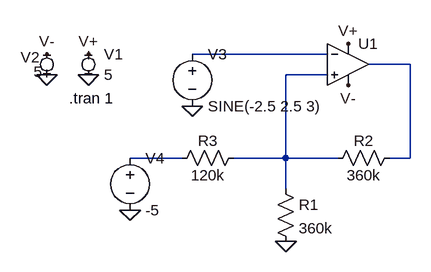
[diagram p0: schematic Zcourbe.asc]
Zcourbe.asc, the LTspice schematic file:
Version 4
SHEET 1 880 680
WIRE 176 112 -32 112
WIRE 304 128 240 128
WIRE 176 144 112 144
WIRE -48 272 -128 272
WIRE 112 272 112 144
WIRE 112 272 32 272
WIRE 192 272 112 272
WIRE 304 272 304 128
WIRE 304 272 272 272
WIRE 112 320 112 272
FLAG -192 112 V+
FLAG 208 96 V+
FLAG -192 144 0
FLAG -256 112 V-
FLAG -256 144 0
FLAG -32 192 0
FLAG 112 400 0
FLAG -128 352 0
FLAG 208 160 V-
SYMBOL MiniSyms4\\voltage- -192 128 R0
WINDOW 123 0 0 Left 2
WINDOW 39 0 0 Left 2
SYMATTR InstName V1
SYMATTR Value 5
SYMBOL MiniSyms4\\voltage- -256 128 R180
WINDOW 0 11 11 Left 2
WINDOW 3 7 -11 Left 2
WINDOW 123 0 0 Left 2
WINDOW 39 0 0 Left 2
SYMATTR InstName V2
SYMATTR Value 5
SYMBOL voltage -32 96 R0
WINDOW 123 0 0 Left 2
WINDOW 39 0 0 Left 2
SYMATTR InstName V3
SYMATTR Value SINE(-2.5 2.5 3)
SYMBOL res 96 304 R0
SYMATTR InstName R1
SYMATTR Value 360k
SYMBOL res 288 256 R90
WINDOW 0 5 56 VBottom 2
WINDOW 3 27 56 VTop 2
SYMATTR InstName R2
SYMATTR Value 360k
SYMBOL res 48 256 R90
WINDOW 0 5 56 VBottom 2
WINDOW 3 27 56 VTop 2
SYMATTR InstName R3
SYMATTR Value 120k
SYMBOL voltage -128 256 R0
WINDOW 123 0 0 Left 2
WINDOW 39 0 0 Left 2
SYMATTR InstName V4
SYMATTR Value -5
SYMBOL Opamps\\UniversalOpamp2 208 128 R0
SYMATTR InstName U1
TEXT -222 180 Left 2 !.tran 1

The netlist it stands for:
* Zcourbe.asc
V1 V+ 0 5
V2 0 V- 5
V3 N001 0 SINE(-2.5 2.5 3)
R1 N003 0 360k
R2 N002 N003 360k
R3 N003 N004 120k
V4 N004 0 -5
XU1 N003 N001 V+ V- N002 level.2 Avol=1Meg GBW=10Meg Slew=10Meg ilimit=25m rail=0 Vos=0 phimargin=45 en=0 enk=0 in=0 ink=0 Rin=500Meg  ; pins IN+ IN- V+ V- OUT
.tran 1
.lib UniversalOpamps2.sub
.backanno
.end